# EAGLE schematic Schematic (EAGLE 9.7.0)
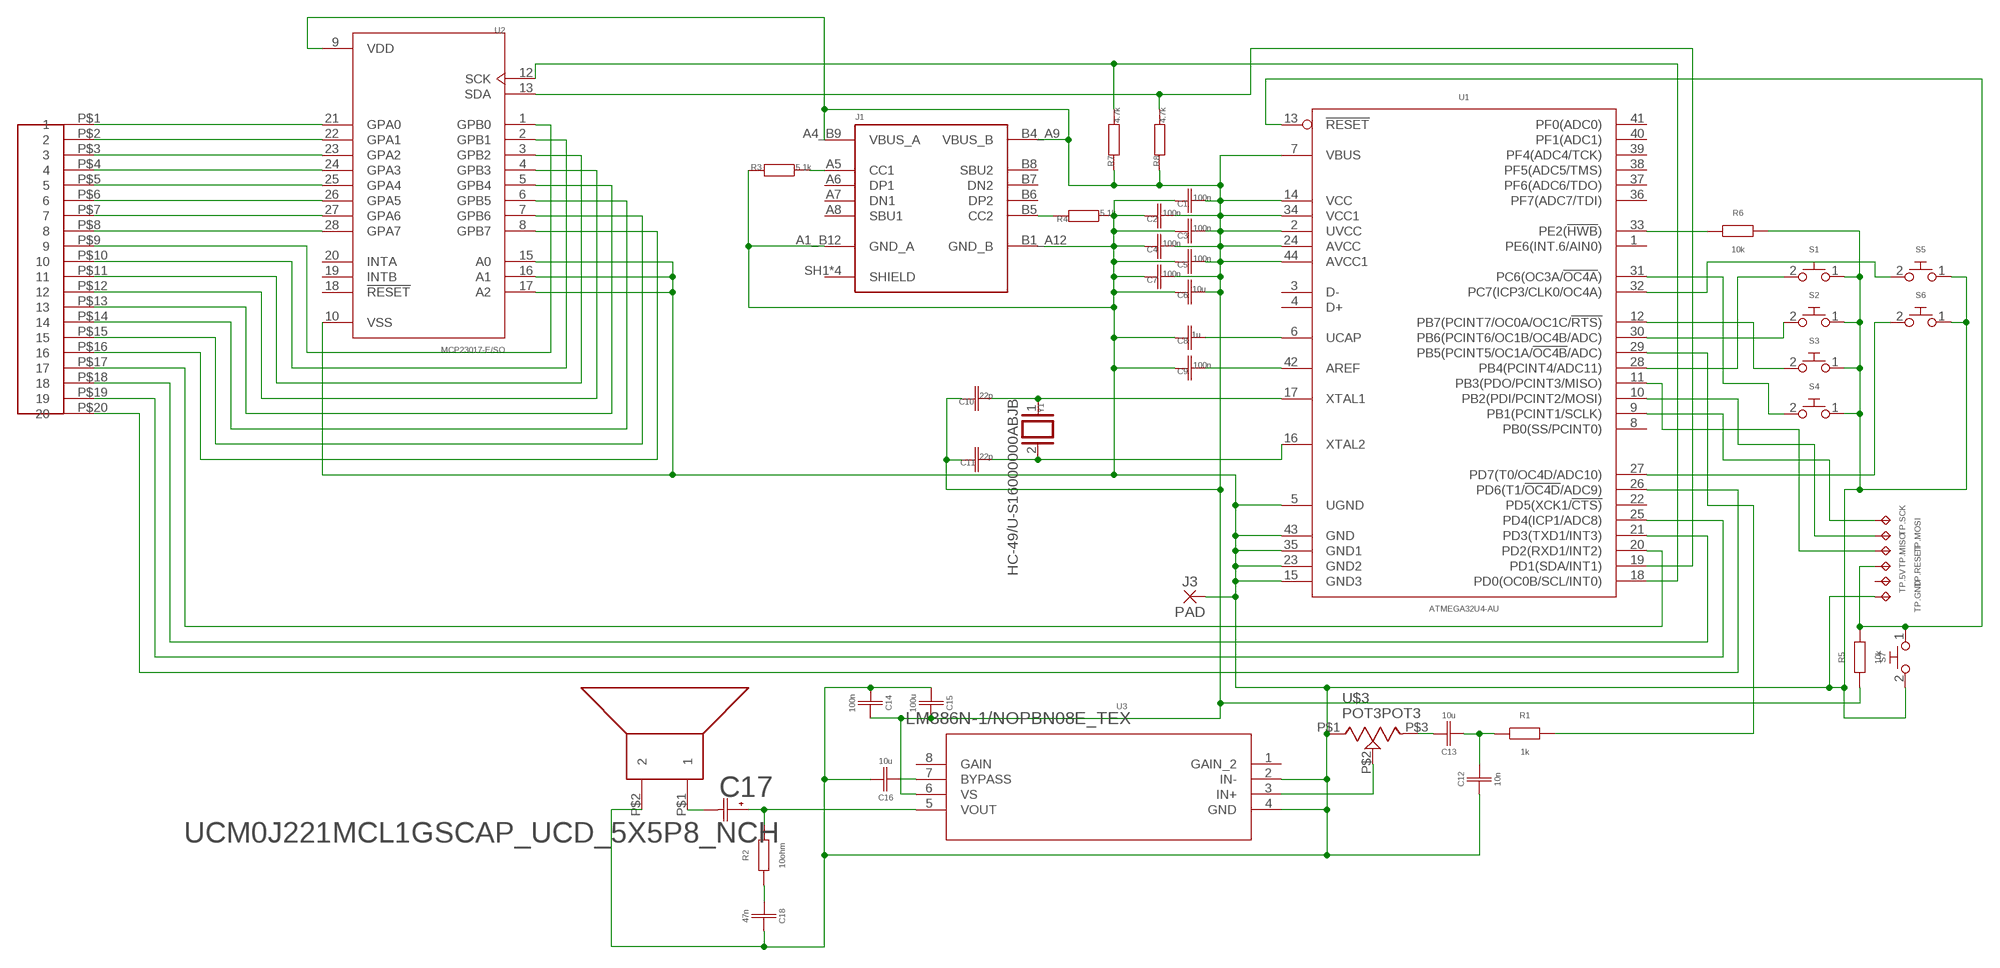
[diagram p0: schematic, sheet 1]

## Parts
C1  100n  C_CHIP-0603(1608-METRIC)  [CAPC1608X85]
C2  100n  C_CHIP-0603(1608-METRIC)  [CAPC1608X85]
C3  100n  C_CHIP-0603(1608-METRIC)  [CAPC1608X85]
C4  100n  C_CHIP-0603(1608-METRIC)  [CAPC1608X85]
C5  100n  C_CHIP-0603(1608-METRIC)  [CAPC1608X85]
C6  10u  C_CHIP-0603(1608-METRIC)  [CAPC1608X85]
C7  100n  C_CHIP-0603(1608-METRIC)  [CAPC1608X85]
C8  1u  C_CHIP-0603(1608-METRIC)  [CAPC1608X85]
C9  100n  C_CHIP-0603(1608-METRIC)  [CAPC1608X85]
C10  22p  C_CHIP-0603(1608-METRIC)  [CAPC1608X85]
C11  22p  C_CHIP-0603(1608-METRIC)  [CAPC1608X85]
C12  10n  C_CHIP-0603(1608-METRIC)  [CAPC1608X85]
C13  10u  C_CHIP-0603(1608-METRIC)  [CAPC1608X85]
C14  100n  C_CHIP-0603(1608-METRIC)  [CAPC1608X85]
C15  100u  C_CHIP-0603(1608-METRIC)  [CAPC1608X85]
C16  10u  C_CHIP-0603(1608-METRIC)  [CAPC1608X85]
C17  UCM0J221MCL1GSCAP_UCD_5X5P8_NCH  [CAP_UCD_5X5P8_NCH]
C18  47n  C_CHIP-0603(1608-METRIC)  [CAPC1608X85]
J1  USB4215-03-A_REVAUSB4115-03-C_REVA  [GCT_USB4215-03-A_REVA]
J3  PAD  [2.54/1.0]
R1  1k  R_CHIP-0603(1608-METRIC)  [RESC1608X60]
R2  10ohm  R_CHIP-0603(1608-METRIC)  [RESC1608X60]
R3  5.1k  R_CHIP-0603(1608-METRIC)  [RESC1608X60]
R4  5.1k  R_CHIP-0603(1608-METRIC)  [RESC1608X60]
R5  10k  R_CHIP-0603(1608-METRIC)  [RESC1608X60]
R6  10k  R_CHIP-0603(1608-METRIC)  [RESC1608X60]
R7  4.7k  R_CHIP-0603(1608-METRIC)  [RESC1608X60]
R8  4.7k  R_CHIP-0603(1608-METRIC)  [RESC1608X60]
S1  B3U-X000B3U-1000P(M)1000P(M)  [B3U-1000P(M)]
S2  B3U-X000B3U-1000P(M)1000P(M)  [B3U-1000P(M)]
S3  B3U-X000B3U-1000P(M)1000P(M)  [B3U-1000P(M)]
S4  B3U-X000B3U-1000P(M)1000P(M)  [B3U-1000P(M)]
S5  B3U-X000B3U-1000P(M)1000P(M)  [B3U-1000P(M)]
S6  B3U-X000B3U-1000P(M)1000P(M)  [B3U-1000P(M)]
S7  B3U-X000B3U-1000P(M)1000P(M)  [B3U-1000P(M)]
TP.5V  TPTP127R  [TP127R]
TP.GND  TPTP127R  [TP127R]
TP.MISO  TPTP127R  [TP127R]
TP.MOSI  TPTP127R  [TP127R]
TP.RESET  TPTP127R  [TP127R]
TP.SCK  TPTP127R  [TP127R]
U1  ATMEGA32U4-AU  [QFP80P1200X1200X120-44]
U2  MCP23017-E/SO  [SOIC127P1030X265-28N]
U3  LM386N-1/NOPBN08E_TEX  [N08E_TEX]
U$1  STYLOPHONEPAD  [STYLOPHONEPCB]
U$2  23072307  [2307]
U$3  POT3POT3  [POT3]
Y1  HC-49/U-S16000000ABJB  [XTAL_HC49P488W43L1150T466H350]

## Nets
5V: C1.1 C2.1 C3.1 C4.1 C5.1 C6.1 C7.1 C10.2 C11.2 C14.2 C15.2 J1.A4_B9(VBUS_A) J1.B4_A9(VBUS_B) R5.1 R7.1 R8.1 U1.2(UVCC) U1.7(VBUS) U1.14(VCC) U1.24(AVCC) U1.34(VCC1) U1.44(AVCC1) U2.9(VDD) U3.6(VS)
GND: C1.2 C2.2 C3.2 C4.2 C5.2 C6.2 C7.2 C8.2 C9.2 C12.1 C14.1 C15.1 C16.2 C18.2 J1.A1_B12(GND_A) J1.B1_A12(GND_B) J3.1(P) R3.2 R4.1 R6.2 S1.1 S2.1 S3.1 S4.1 S5.1 S6.1 S7.2 TP.GND.TP U1.5(UGND) U1.15(GND3) U1.23(GND2) U1.35(GND1) U1.43(GND) U2.10(VSS) U2.15(A0) U2.16(A1) U2.17(A2) U3.2(IN-) U3.4(GND) U$2.P$2 U$3.P$1(CCW)
N$1: R7.2 U1.18(PD0(OC0B/SCL/INT0)) U2.12(SCK)
N$2: R8.2 U1.19(PD1(SDA/INT1)) U2.13(SDA)
N$3: U2.21(GPA0) U$1.P$1
N$4: U2.22(GPA1) U$1.P$2
N$5: U2.23(GPA2) U$1.P$3
N$6: U2.24(GPA3) U$1.P$4
N$7: U2.25(GPA4) U$1.P$5
N$8: U2.26(GPA5) U$1.P$6
N$9: U2.27(GPA6) U$1.P$7
N$10: U2.28(GPA7) U$1.P$8
N$11: U2.1(GPB0) U$1.P$9
N$12: U2.2(GPB1) U$1.P$10
N$13: U2.3(GPB2) U$1.P$11
N$14: U2.4(GPB3) U$1.P$12
N$15: U2.5(GPB4) U$1.P$13
N$16: U2.6(GPB5) U$1.P$14
N$17: U2.7(GPB6) U$1.P$15
N$18: U2.8(GPB7) U$1.P$16
N$19: U1.20(PD2(RXD1/INT2)) U$1.P$17
N$20: U1.21(PD3(TXD1/INT3)) U$1.P$18
N$21: U1.25(PD4(ICP1/ADC8)) U$1.P$19
N$22: U1.26(PD6(T1/!OC4D!/ADC9)) U$1.P$20
N$23: S1.2 U1.28(PB4(PCINT4/ADC11))
N$24: S2.2 U1.30(PB6(PCINT6/OC1B/OC4B/ADC))
N$25: S3.2 U1.12(PB7(PCINT7/OC0A/OC1C/!RTS))
N$26: S4.2 U1.31(PC6(OC3A/!OC4A!))
N$27: S5.2 U1.32(PC7(ICP3/CLK0/OC4A))
N$28: S6.2 U1.27(PD7(T0/OC4D/ADC10))
N$29: C18.1 R2.1
N$30: R1.2 U1.29(PB5(PCINT5/OC1A/!OC4B!/ADC))
N$31: C12.2 C13.1 R1.1
N$32: C13.2 U$3.P$3(CW)
N$33: U3.3(IN+) U$3.P$2(WIPER)
N$34: C16.1 U3.7(BYPASS)
N$35: C9.1 U1.42(AREF)
N$37: C11.1 U1.16(XTAL2) Y1.2
N$38: C17.1 R2.2 U3.5(VOUT)
N$39: J1.B5(CC2) R4.2
N$40: J1.A5(CC1) R3.1
N$41: C8.1 U1.6(UCAP)
N$42: R6.1 U1.33(PE2(!HWB!))
N$43: TP.SCK.TP U1.9(PB1(PCINT1/SCLK))
N$44: TP.MOSI.TP U1.10(PB2(PDI/PCINT2/MOSI))
N$45: TP.MISO.TP U1.11(PB3(PDO/PCINT3/MISO))
N$46: R5.2 S7.1 TP.RESET.TP U1.13(!RESET)
N$47: C10.1 U1.17(XTAL1) Y1.1
N$48: C17.2 U$2.P$1
Unconnected: J1.A6(DP1) J1.A7(DN1) J1.A8(SBU1) J1.B6(DP2) J1.B7(DN2) J1.B8(SBU2) J1.SH1(SHIELD) J1.SH2(SHIELD) J1.SH3(SHIELD) J1.SH4(SHIELD) TP.5V.TP U1.1(PE6(INT.6/AIN0)) U1.3(D-) U1.4(D+) U1.8(PB0(SS/PCINT0)) U1.22(PD5(XCK1/!CTS)) U1.36(PF7(ADC7/TDI)) U1.37(PF6(ADC6/TDO)) U1.38(PF5(ADC5/TMS)) U1.39(PF4(ADC4/TCK)) U1.40(PF1(ADC1)) U1.41(PF0(ADC0)) U2.18(!RESET) U2.19(INTB) U2.20(INTA) U3.1(GAIN_2) U3.8(GAIN)

## Library data of the parts
C1-C16 C18 = Capacitor:C: Capacitor - Generic
C17 = 2026-10-24_01-56-39_Library:UCM0J221MCL1GS
J1 = USB4215-03-A_REVA:USB4215-03-A_REVA
J3 = Connector:PAD: Through-Hole Pad
R1-R8 = Resistor:R: Resistor Fixed - Generic
S1-S7 = Switch:B3U-X000: Ultra-small Tactile Switch Contact form : SPST-NO Reference: Datasheet <https://omronfs.omron.com/en_US/ecb/products/pdf/en-b3u.pdf>
TP.5V TP.GND TP.MISO TP.MOSI TP.RESET TP.SCK = PCB_Utilities:TP: Test Pad
U1 = IC_Embedded:ATMEGA*U4: 8-bit Microcontroller Reference: Datasheet <https://ww1.microchip.com/downloads/en/DeviceDoc/Atmel-7766-8-bit-AVR-ATmega16U4-32U4_Datasheet.pdf> Note: User needs to add thermal via in thermal pad or this part in QFN package while designing a board.
U2 = MCP23017-E_SO:MCP23017-E/SO: Check availability <https://pricing.snapeda.com/parts/MCP23017-E/SO/Microchip/view-part?ref=eda>
U3 = 2026-10-22_22-21-42_Library:LM386N-1/NOPB
U$1 = Stylophone Pads:STYLOPHONEPAD
U$2 = 2307 Speaker:2307
U$3 = POT3:POT3
Y1 = HC-49_U-S16000000ABJB:HC-49/U-S16000000ABJB: Check availability <https://pricing.snapeda.com/parts/HC-49/U-S16000000ABJB/Citizen%20Finedevice/view-part?ref=eda>